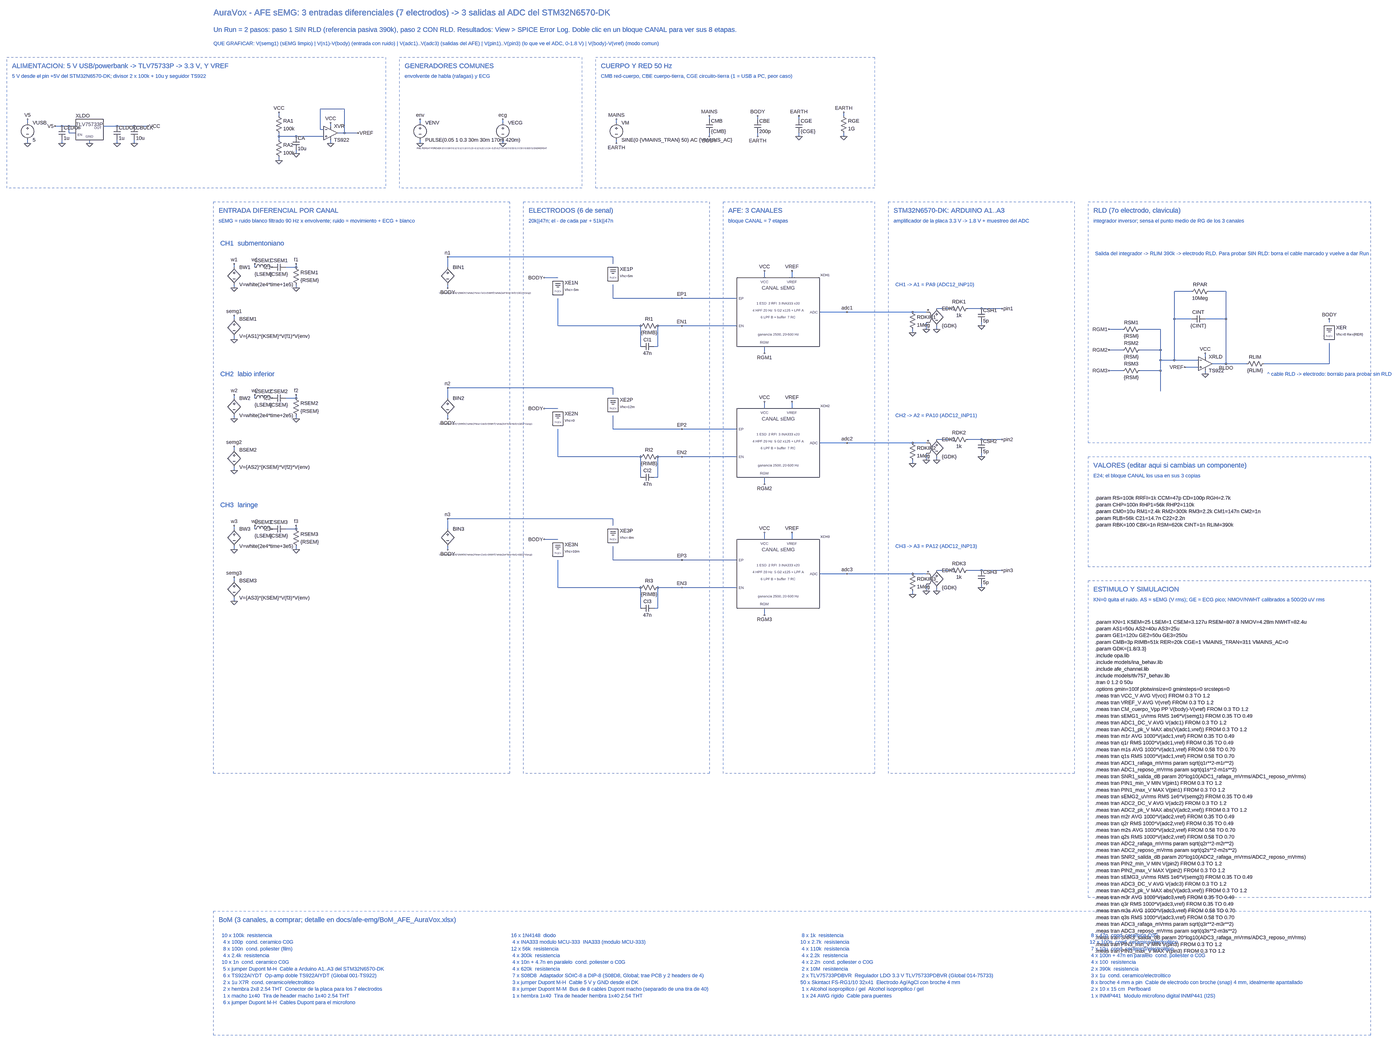
[diagram p0: schematic AuraVox_AFE.asc, whole sheet]
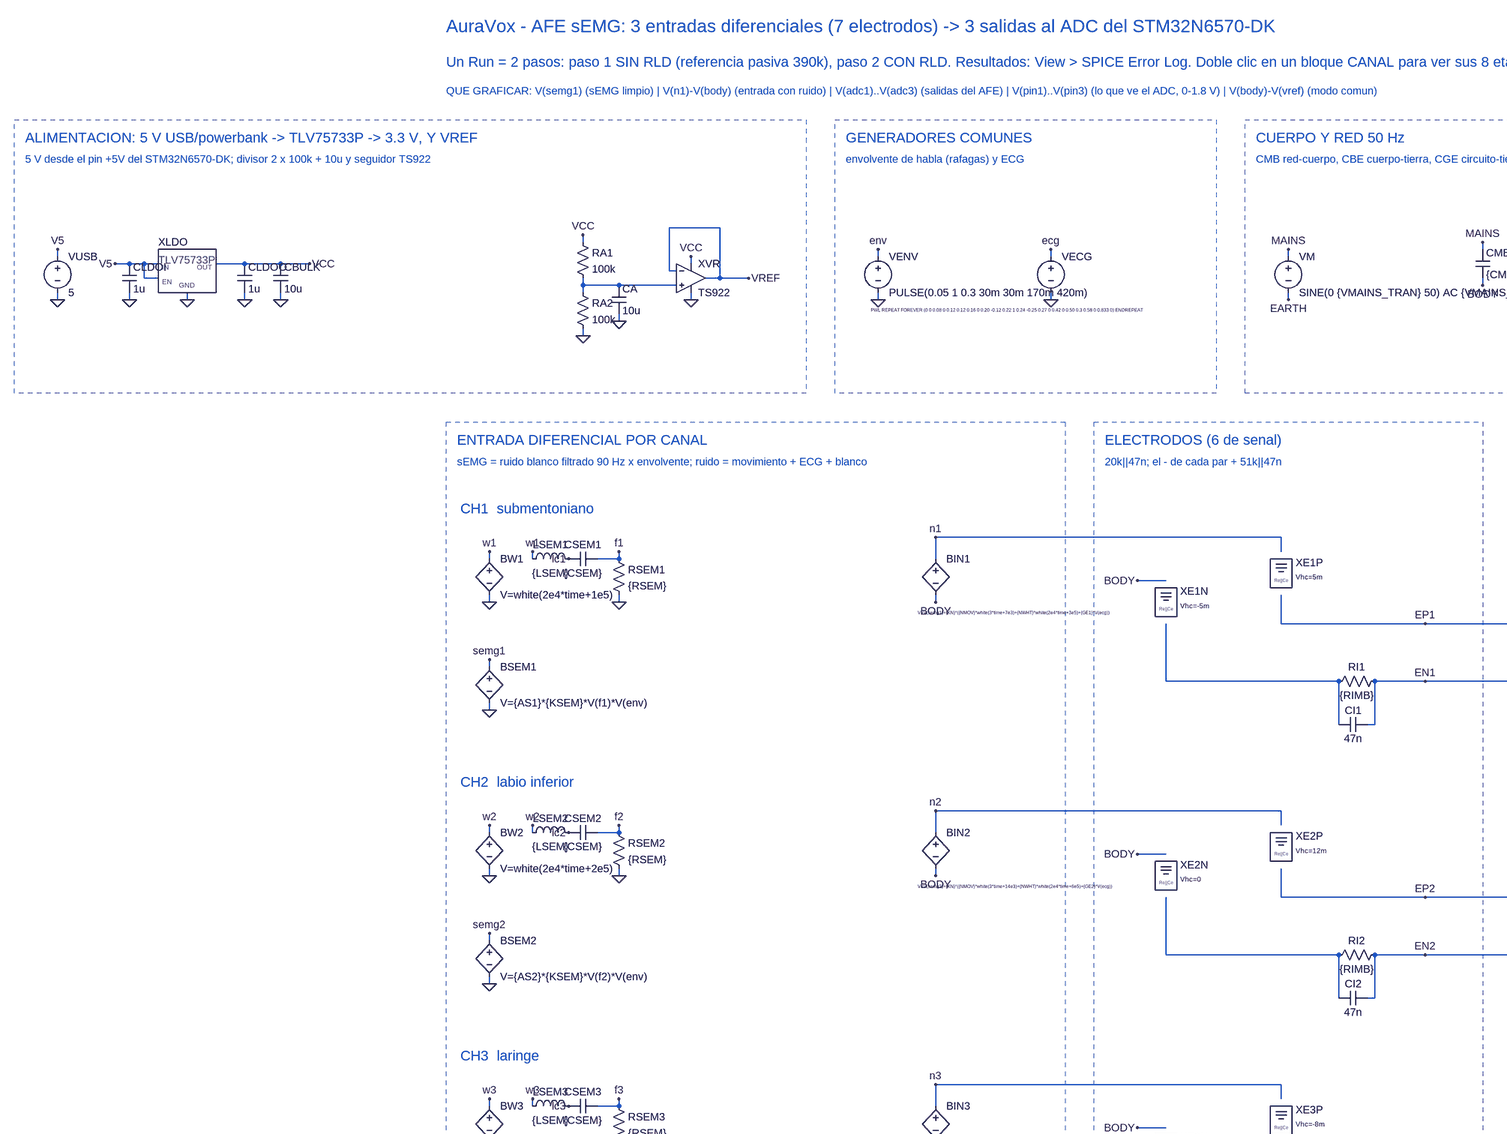
[diagram p1: schematic AuraVox_AFE.asc, part, row 1 of 2, column 1 of 2]
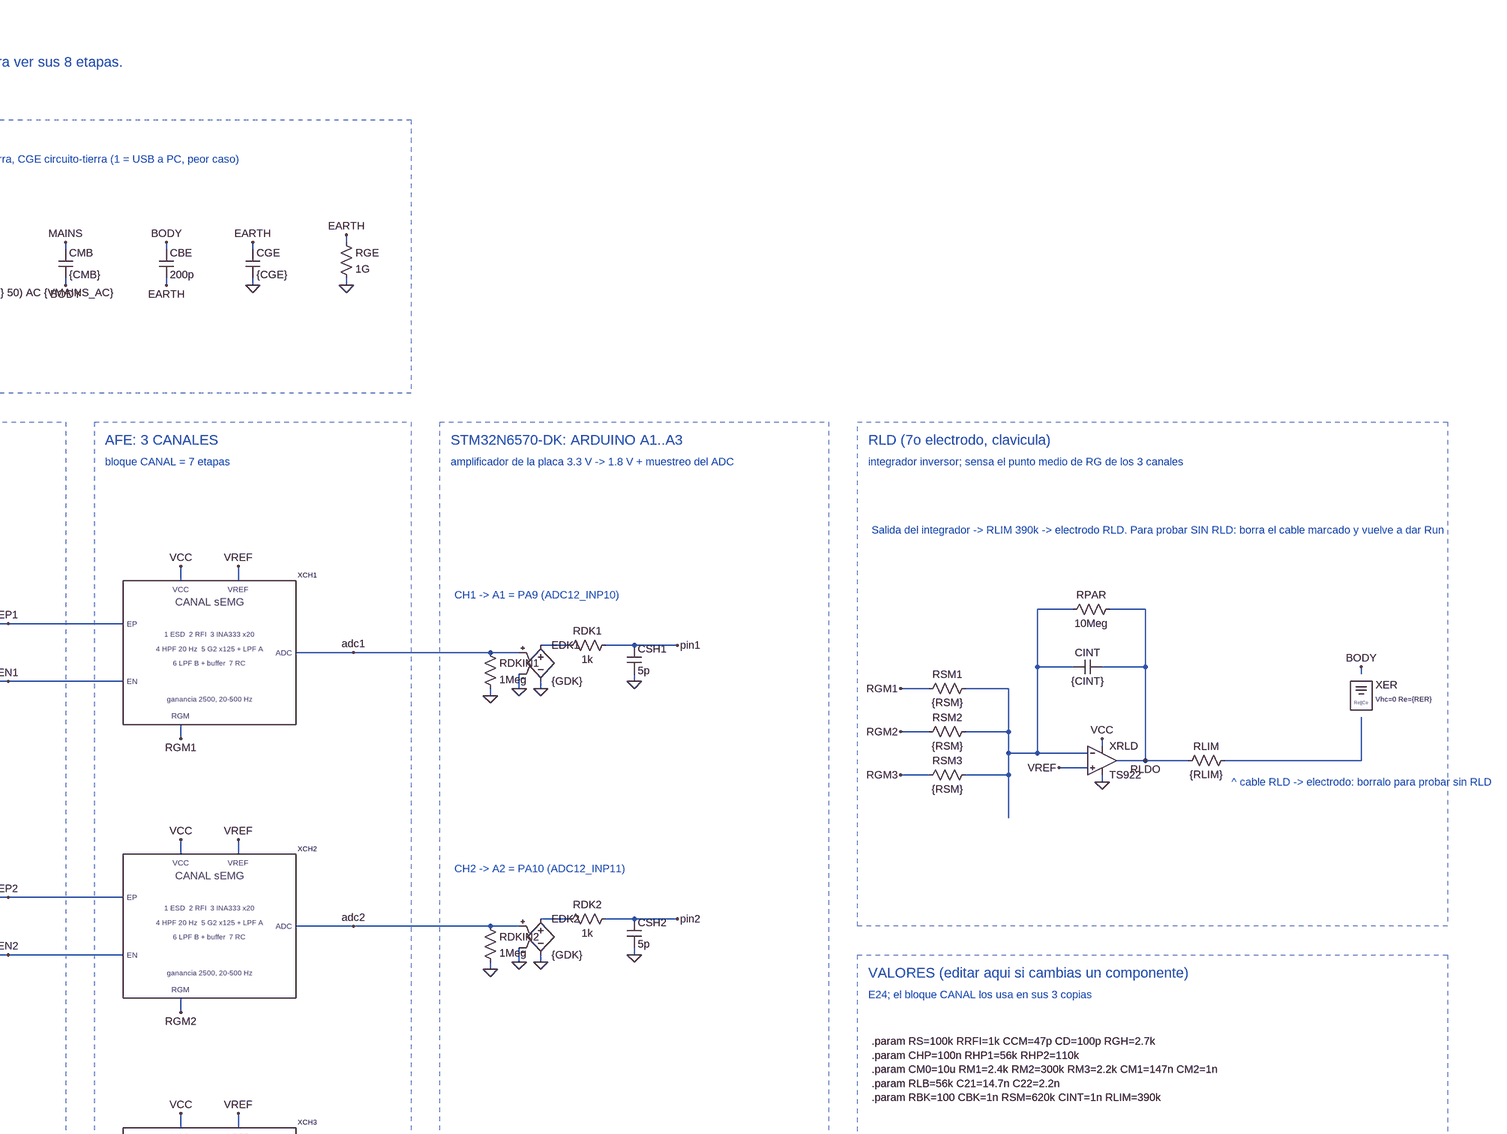
[diagram p2: schematic AuraVox_AFE.asc, part, row 1 of 2, column 2 of 2]
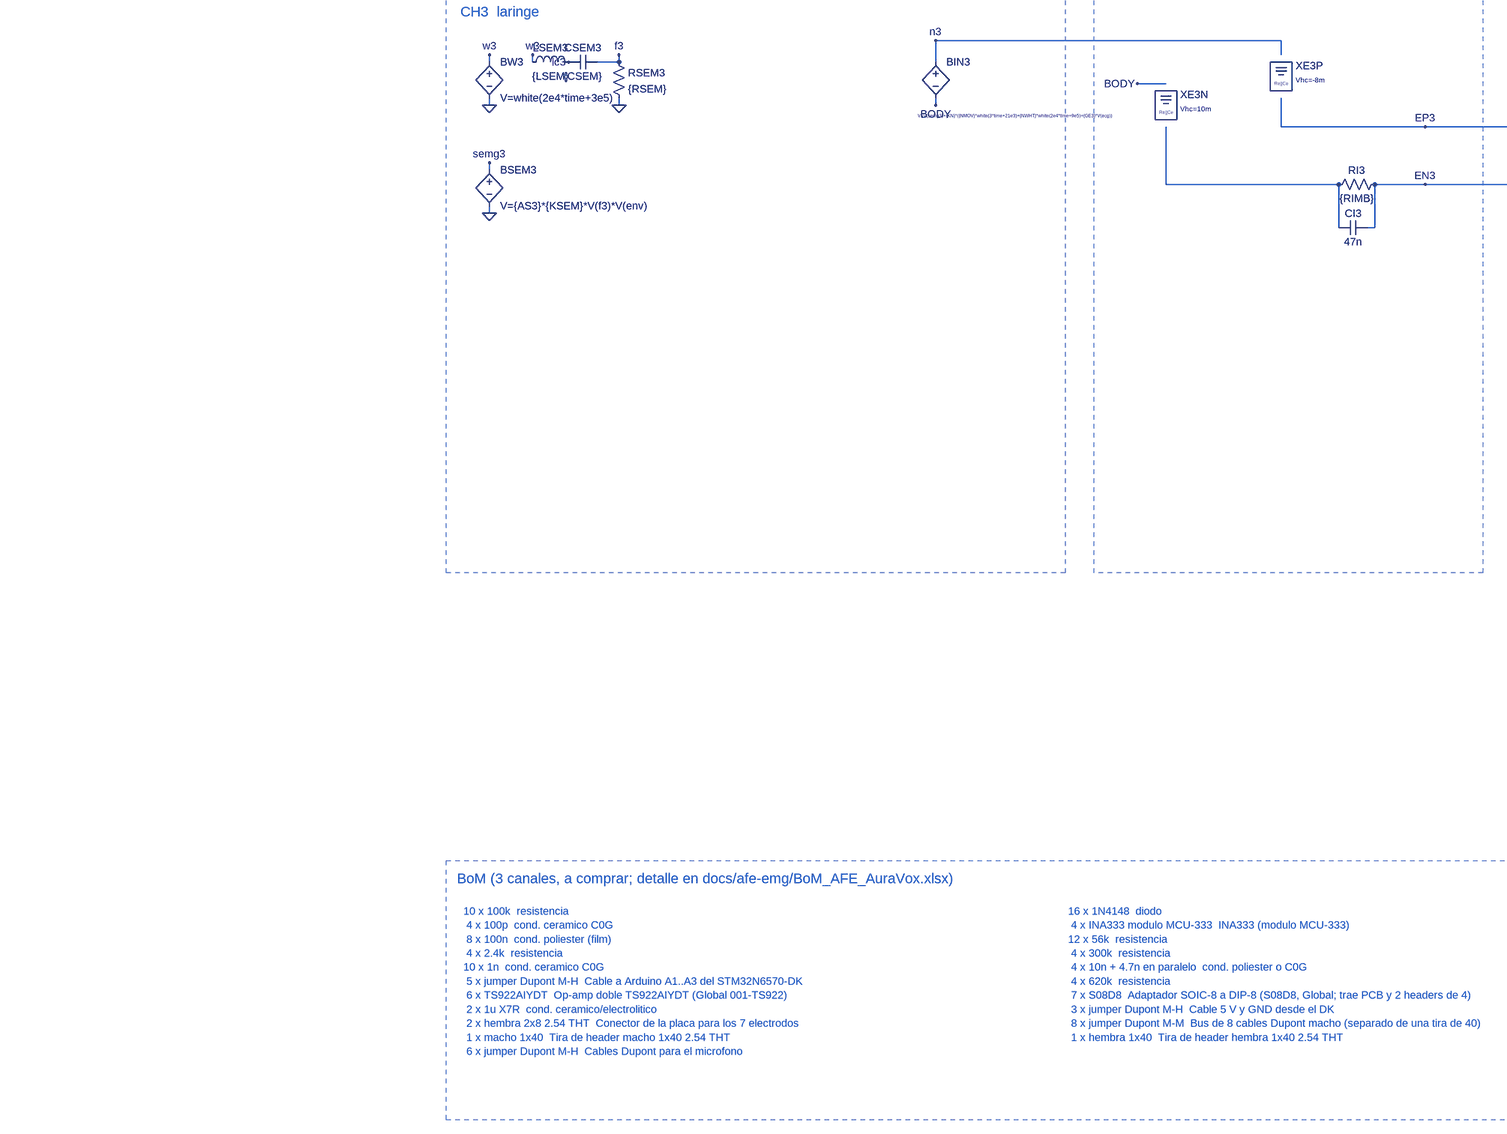
[diagram p3: schematic AuraVox_AFE.asc, part, row 2 of 2, column 1 of 2]
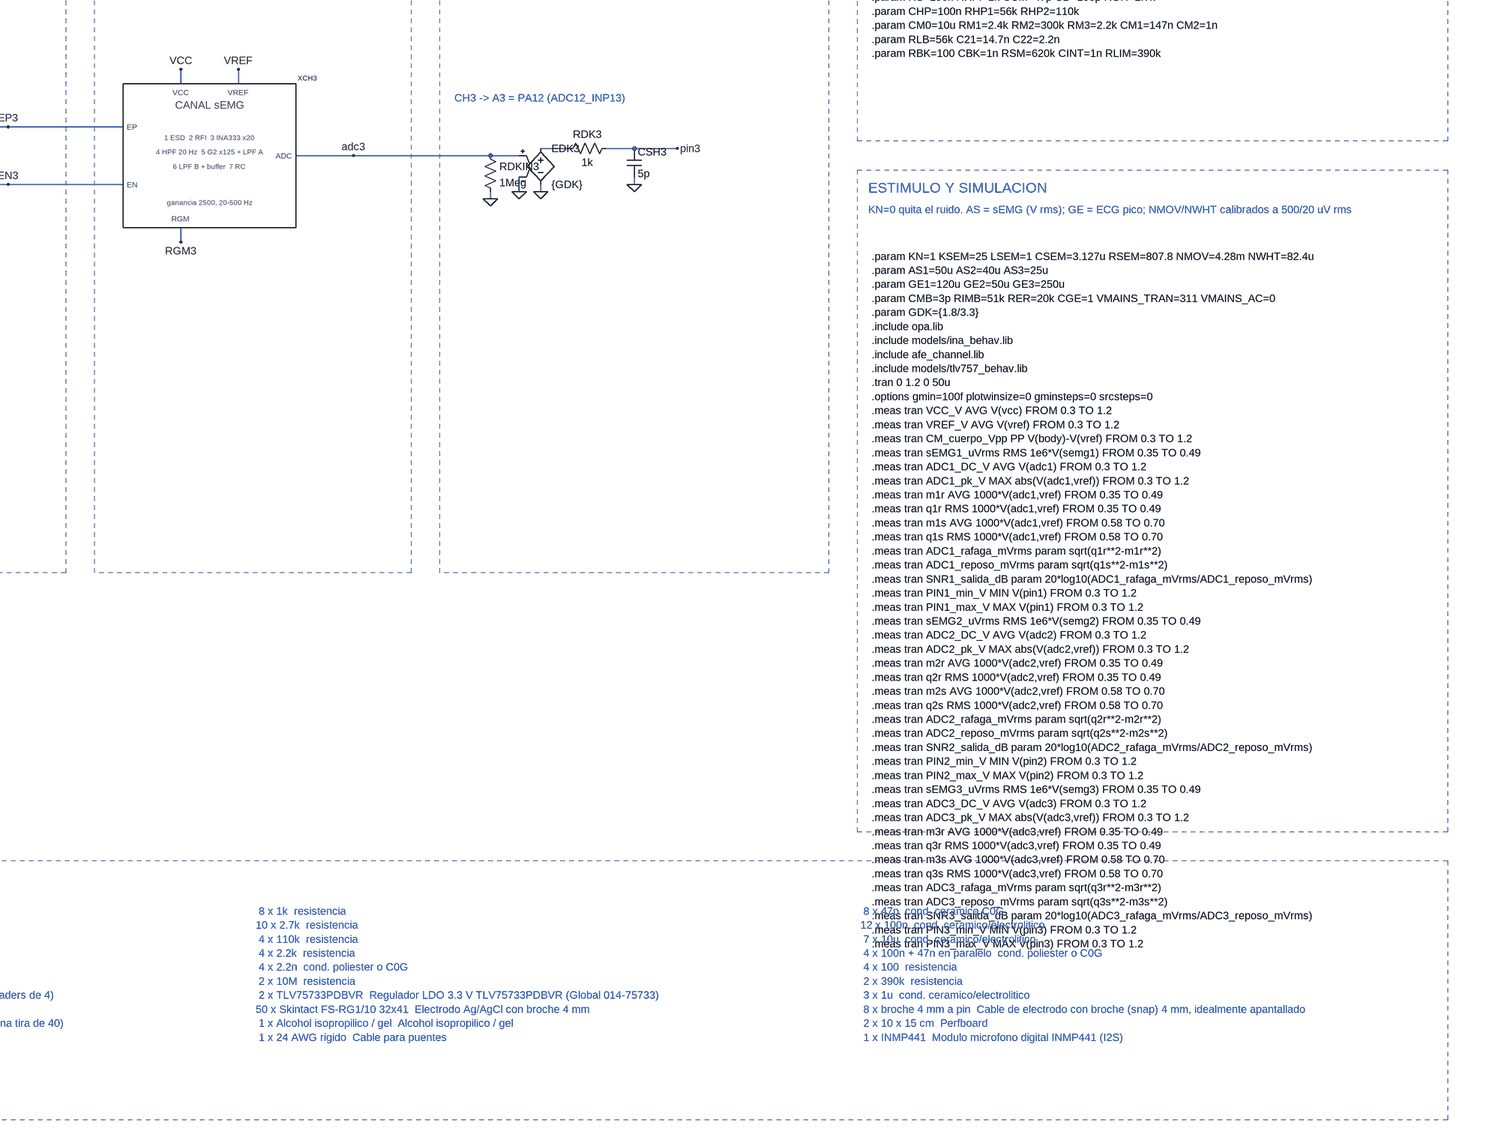
[diagram p4: schematic AuraVox_AFE.asc, part, row 2 of 2, column 2 of 2]
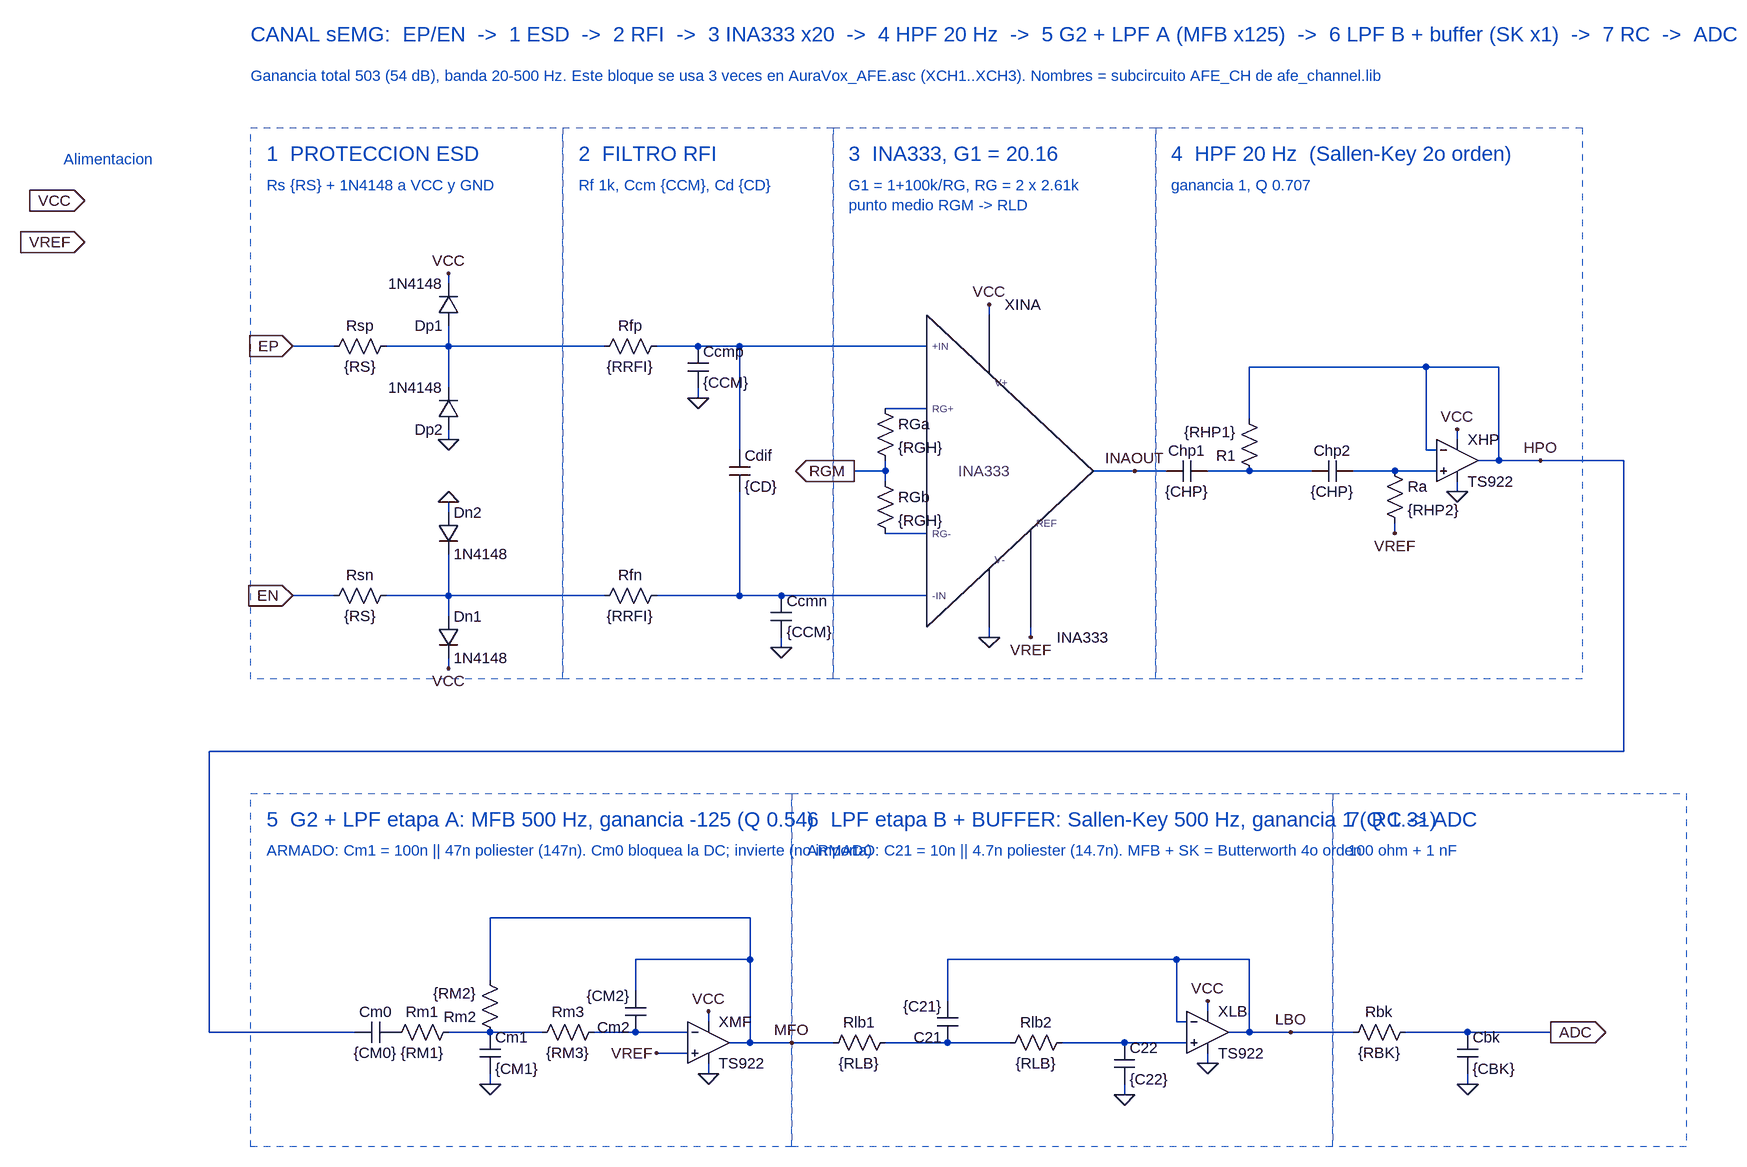
[diagram p5: sub-circuit canal.asc]
AuraVox_AFE.asc, the LTspice schematic file:
Version 4
SHEET 1 4400 3800
WIRE -2464 -560 -2464 -576
WIRE -2464 -480 -2464 -464
WIRE -2240 -544 -2304 -544
WIRE -2304 -544 -2336 -544
WIRE -2240 -512 -2272 -512
WIRE -2272 -512 -2272 -544
WIRE -2304 -480 -2304 -464
WIRE -2176 -480 -2176 -464
WIRE -2112 -544 -2048 -544
WIRE -2048 -544 -1968 -544
WIRE -1968 -544 -1904 -544
WIRE -2048 -480 -2048 -464
WIRE -1968 -480 -1968 -464
WIRE -1296 -592 -1296 -608
WIRE -1296 -512 -1296 -496
WIRE -1296 -496 -1296 -480
WIRE -1296 -400 -1296 -384
WIRE -1296 -496 -1216 -496
WIRE -1216 -496 -1088 -496
WIRE -1216 -432 -1216 -416
WIRE -1056 -544 -1056 -560
WIRE -1056 -480 -1056 -464
WIRE -1024 -512 -992 -512
WIRE -1104 -624 -992 -624
WIRE -992 -624 -992 -512
WIRE -1088 -528 -1104 -528
WIRE -1104 -528 -1104 -624
WIRE -992 -512 -928 -512
WIRE -640 -560 -640 -576
WIRE -640 -480 -640 -464
WIRE -256 -560 -256 -576
WIRE -256 -480 -256 -464
WIRE 272 -560 272 -576
WIRE 272 -480 272 -464
WIRE 704 -576 704 -592
WIRE 704 -512 704 -496
WIRE 928 -576 928 -592
WIRE 928 -512 928 -496
WIRE 1120 -576 1120 -592
WIRE 1120 -512 1120 -496
WIRE 1328 -592 1328 -608
WIRE 1328 -512 1328 -496
WIRE -1504 112 -1504 96
WIRE -1504 192 -1504 208
WIRE -1408 112 -1408 96
WIRE -1264 112 -1216 112
WIRE -1216 112 -1216 96
WIRE -1216 192 -1216 208
WIRE -1504 352 -1504 336
WIRE -1504 432 -1504 448
WIRE -512 192 -512 208
WIRE -512 112 -512 64
WIRE -512 64 256 64
WIRE 256 64 256 96
WIRE 256 192 256 256
WIRE 256 256 576 256
WIRE 576 256 832 256
WIRE 0 160 -64 160
WIRE 0 256 0 384
WIRE 0 384 384 384
WIRE 384 384 384 480
WIRE 448 480 464 480
WIRE 464 480 464 384
WIRE 464 384 576 384
WIRE 576 384 832 384
WIRE 960 160 960 128
WIRE 1088 160 1088 128
WIRE 960 480 960 512
WIRE 1216 320 1344 320
WIRE 1344 320 1600 320
WIRE 1600 320 1648 320
WIRE 1648 320 1712 320
WIRE 1648 400 1648 416
WIRE 1712 368 1712 400
WIRE 1760 384 1760 400
WIRE 1760 304 1824 304
WIRE 1904 304 1968 304
WIRE 1968 304 2064 304
WIRE 1968 368 1968 384
WIRE -1504 720 -1504 704
WIRE -1504 800 -1504 816
WIRE -1408 720 -1408 704
WIRE -1264 720 -1216 720
WIRE -1216 720 -1216 704
WIRE -1216 800 -1216 816
WIRE -1504 960 -1504 944
WIRE -1504 1040 -1504 1056
WIRE -512 800 -512 816
WIRE -512 720 -512 672
WIRE -512 672 256 672
WIRE 256 672 256 704
WIRE 256 800 256 864
WIRE 256 864 576 864
WIRE 576 864 832 864
WIRE 0 768 -64 768
WIRE 0 864 0 992
WIRE 0 992 384 992
WIRE 384 992 384 1088
WIRE 448 1088 464 1088
WIRE 464 1088 464 992
WIRE 464 992 576 992
WIRE 576 992 832 992
WIRE 960 768 960 736
WIRE 1088 768 1088 736
WIRE 960 1088 960 1120
WIRE 1216 928 1344 928
WIRE 1344 928 1600 928
WIRE 1600 928 1648 928
WIRE 1648 928 1712 928
WIRE 1648 1008 1648 1024
WIRE 1712 976 1712 1008
WIRE 1760 992 1760 1008
WIRE 1760 912 1824 912
WIRE 1904 912 1968 912
WIRE 1968 912 2064 912
WIRE 1968 976 1968 992
WIRE -1504 1328 -1504 1312
WIRE -1504 1408 -1504 1424
WIRE -1408 1328 -1408 1312
WIRE -1264 1328 -1216 1328
WIRE -1216 1328 -1216 1312
WIRE -1216 1408 -1216 1424
WIRE -1504 1568 -1504 1552
WIRE -1504 1648 -1504 1664
WIRE -512 1408 -512 1424
WIRE -512 1328 -512 1280
WIRE -512 1280 256 1280
WIRE 256 1280 256 1312
WIRE 256 1408 256 1472
WIRE 256 1472 576 1472
WIRE 576 1472 832 1472
WIRE 0 1376 -64 1376
WIRE 0 1472 0 1600
WIRE 0 1600 384 1600
WIRE 384 1600 384 1696
WIRE 448 1696 464 1696
WIRE 464 1696 464 1600
WIRE 464 1600 576 1600
WIRE 576 1600 832 1600
WIRE 960 1376 960 1344
WIRE 1088 1376 1088 1344
WIRE 960 1696 960 1728
WIRE 1216 1536 1344 1536
WIRE 1344 1536 1600 1536
WIRE 1600 1536 1648 1536
WIRE 1648 1536 1712 1536
WIRE 1648 1616 1648 1632
WIRE 1712 1584 1712 1616
WIRE 1760 1600 1760 1616
WIRE 1760 1520 1824 1520
WIRE 1904 1520 1968 1520
WIRE 1968 1520 2064 1520
WIRE 1968 1584 1968 1600
WIRE 2624 400 2560 400
WIRE 2704 400 2800 400
WIRE 2624 496 2560 496
WIRE 2704 496 2800 496
WIRE 2624 592 2560 592
WIRE 2704 592 2800 592
WIRE 2800 400 2800 688
WIRE 3008 528 3008 512
WIRE 3008 592 3008 608
WIRE 2800 544 2864 544
WIRE 2864 544 2944 544
WIRE 2944 544 2976 544
WIRE 2976 576 2912 576
WIRE 2864 544 2864 352
WIRE 2864 352 2944 352
WIRE 2864 352 2864 224
WIRE 2864 224 2944 224
WIRE 3008 352 3104 352
WIRE 3024 224 3104 224
WIRE 3104 224 3104 352
WIRE 3104 352 3104 560
WIRE 3040 560 3104 560
WIRE 3104 560 3200 560
WIRE 3280 560 3584 560
WIRE 3584 560 3584 464
WIRE 3584 368 3584 352
FLAG -2464 -576 V5
FLAG -2464 -464 0
FLAG -2336 -544 V5
FLAG -2304 -464 0
FLAG -2176 -464 0
FLAG -1904 -544 VCC
FLAG -2048 -464 0
FLAG -1968 -464 0
FLAG -1296 -608 VCC
FLAG -1296 -384 0
FLAG -1216 -416 0
FLAG -1056 -560 VCC
FLAG -1056 -464 0
FLAG -928 -512 VREF
FLAG -640 -576 env
FLAG -640 -464 0
FLAG -256 -576 ecg
FLAG -256 -464 0
FLAG 272 -576 MAINS
FLAG 272 -464 EARTH
FLAG 704 -592 MAINS
FLAG 704 -496 BODY
FLAG 928 -592 BODY
FLAG 928 -496 EARTH
FLAG 1120 -592 EARTH
FLAG 1120 -496 0
FLAG 1328 -608 EARTH
FLAG 1328 -496 0
FLAG -1504 96 w1
FLAG -1504 208 0
FLAG -1408 96 w1
FLAG -1328 112 lc1
FLAG -1216 96 f1
FLAG -1216 208 0
FLAG -1504 336 semg1
FLAG -1504 448 0
FLAG -512 208 BODY
FLAG -512 64 n1
FLAG -64 160 BODY
FLAG 576 256 EP1
FLAG 576 384 EN1
FLAG 960 128 VCC
FLAG 1088 128 VREF
FLAG 960 512 RGM1
FLAG 1344 320 adc1
FLAG 1648 416 0
FLAG 1712 400 0
FLAG 1760 400 0
FLAG 1968 384 0
FLAG 2064 304 pin1
FLAG -1504 704 w2
FLAG -1504 816 0
FLAG -1408 704 w2
FLAG -1328 720 lc2
FLAG -1216 704 f2
FLAG -1216 816 0
FLAG -1504 944 semg2
FLAG -1504 1056 0
FLAG -512 816 BODY
FLAG -512 672 n2
FLAG -64 768 BODY
FLAG 576 864 EP2
FLAG 576 992 EN2
FLAG 960 736 VCC
FLAG 1088 736 VREF
FLAG 960 1120 RGM2
FLAG 1344 928 adc2
FLAG 1648 1024 0
FLAG 1712 1008 0
FLAG 1760 1008 0
FLAG 1968 992 0
FLAG 2064 912 pin2
FLAG -1504 1312 w3
FLAG -1504 1424 0
FLAG -1408 1312 w3
FLAG -1328 1328 lc3
FLAG -1216 1312 f3
FLAG -1216 1424 0
FLAG -1504 1552 semg3
FLAG -1504 1664 0
FLAG -512 1424 BODY
FLAG -512 1280 n3
FLAG -64 1376 BODY
FLAG 576 1472 EP3
FLAG 576 1600 EN3
FLAG 960 1344 VCC
FLAG 1088 1344 VREF
FLAG 960 1728 RGM3
FLAG 1344 1536 adc3
FLAG 1648 1632 0
FLAG 1712 1616 0
FLAG 1760 1616 0
FLAG 1968 1600 0
FLAG 2064 1520 pin3
FLAG 2560 400 RGM1
FLAG 2560 496 RGM2
FLAG 2560 592 RGM3
FLAG 3008 512 VCC
FLAG 3008 608 0
FLAG 2912 576 VREF
FLAG 3584 352 BODY
FLAG 3104 560 RLDO
SYMBOL voltage -2464 -576 R0
SYMATTR InstName VUSB
SYMATTR Value 5
SYMBOL TLV75733P -2176 -528 R0
SYMATTR InstName XLDO
SYMATTR Value TLV75733P
SYMBOL cap -2320 -544 R0
SYMATTR InstName CLDOI
SYMATTR Value 1u
SYMBOL cap -2064 -544 R0
SYMATTR InstName CLDOO
SYMATTR Value 1u
SYMBOL cap -1984 -544 R0
SYMATTR InstName CBULK
SYMATTR Value 10u
SYMBOL res -1312 -608 R0
SYMATTR InstName RA1
SYMATTR Value 100k
SYMBOL res -1312 -496 R0
SYMATTR InstName RA2
SYMATTR Value 100k
SYMBOL cap -1232 -496 R0
SYMATTR InstName CA
SYMATTR Value 10u
SYMBOL OpAmps\\opamp2 -1056 -576 R0
SYMATTR InstName XVR
SYMATTR Value TS922
SYMBOL voltage -640 -576 R0
SYMATTR InstName VENV
SYMATTR Value PULSE(0.05 1 0.3 30m 30m 170m 420m)
SYMBOL voltage -256 -576 R0
WINDOW 0 24 16 Left 2
WINDOW 3 -400 136 Left 0
SYMATTR InstName VECG
SYMATTR Value PWL REPEAT FOREVER (0 0 0.08 0 0.12 0.12 0.16 0 0.20 -0.12 0.22 1 0.24 -0.25 0.27 0 0.42 0 0.50 0.3 0.58 0 0.833 0) ENDREPEAT
SYMBOL voltage 272 -576 R0
SYMATTR InstName VM
SYMATTR Value SINE(0 {VMAINS_TRAN} 50) AC {VMAINS_AC}
SYMBOL cap 688 -576 R0
SYMATTR InstName CMB
SYMATTR Value {CMB}
SYMBOL cap 912 -576 R0
SYMATTR InstName CBE
SYMATTR Value 200p
SYMBOL cap 1104 -576 R0
SYMATTR InstName CGE
SYMATTR Value {CGE}
SYMBOL res 1312 -608 R0
SYMATTR InstName RGE
SYMATTR Value 1G
SYMBOL bv -1504 96 R0
SYMATTR InstName BW1
SYMATTR Value V=white(2e4*time+1e5)
SYMBOL ind -1424 128 R270
WINDOW 0 32 56 VTop 2
WINDOW 3 0 56 VBottom 2
SYMATTR InstName LSEM1
SYMATTR Value {LSEM}
SYMBOL cap -1328 128 R270
WINDOW 0 32 32 VTop 2
WINDOW 3 0 32 VBottom 2
SYMATTR InstName CSEM1
SYMATTR Value {CSEM}
SYMBOL res -1232 96 R0
SYMATTR InstName RSEM1
SYMATTR Value {RSEM}
SYMBOL bv -1504 336 R0
SYMATTR InstName BSEM1
SYMATTR Value V={AS1}*{KSEM}*V(f1)*V(env)
SYMBOL bv -512 96 R0
WINDOW 0 24 16 Left 2
WINDOW 3 -40 136 Left 0
SYMATTR InstName BIN1
SYMATTR Value V=V(semg1)+{KN}*({NMOV}*white(3*time+7e3)+{NWHT}*white(2e4*time+3e5)+{GE1}*V(ecg))
SYMBOL ELECTRODO 256 96 R0
SYMATTR InstName XE1P
SYMATTR Value ELECTRODE
SYMATTR SpiceLine Vhc=5m
SYMBOL ELECTRODO 0 160 R0
SYMATTR InstName XE1N
SYMATTR Value ELECTRODE
SYMATTR SpiceLine Vhc=-5m
SYMBOL res 368 400 R270
WINDOW 0 32 56 VTop 2
WINDOW 3 0 56 VBottom 2
SYMATTR InstName RI1
SYMATTR Value {RIMB}
SYMBOL cap 384 496 R270
WINDOW 0 32 32 VTop 2
WINDOW 3 0 32 VBottom 2
SYMATTR InstName CI1
SYMATTR Value 47n
SYMBOL CANAL 1024 320 R0
SYMATTR InstName XCH1
SYMBOL res 1632 304 R0
SYMATTR InstName RDKIN1
SYMATTR Value 1Meg
SYMBOL e 1760 288 R0
SYMATTR InstName EDK1
SYMATTR Value {GDK}
SYMBOL res 1808 320 R270
WINDOW 0 32 56 VTop 2
WINDOW 3 0 56 VBottom 2
SYMATTR InstName RDK1
SYMATTR Value 1k
SYMBOL cap 1952 304 R0
SYMATTR InstName CSH1
SYMATTR Value 5p
SYMBOL bv -1504 704 R0
SYMATTR InstName BW2
SYMATTR Value V=white(2e4*time+2e5)
SYMBOL ind -1424 736 R270
WINDOW 0 32 56 VTop 2
WINDOW 3 0 56 VBottom 2
SYMATTR InstName LSEM2
SYMATTR Value {LSEM}
SYMBOL cap -1328 736 R270
WINDOW 0 32 32 VTop 2
WINDOW 3 0 32 VBottom 2
SYMATTR InstName CSEM2
SYMATTR Value {CSEM}
SYMBOL res -1232 704 R0
SYMATTR InstName RSEM2
SYMATTR Value {RSEM}
SYMBOL bv -1504 944 R0
SYMATTR InstName BSEM2
SYMATTR Value V={AS2}*{KSEM}*V(f2)*V(env)
SYMBOL bv -512 704 R0
WINDOW 0 24 16 Left 2
WINDOW 3 -40 136 Left 0
SYMATTR InstName BIN2
SYMATTR Value V=V(semg2)+{KN}*({NMOV}*white(3*time+14e3)+{NWHT}*white(2e4*time+6e5)+{GE2}*V(ecg))
SYMBOL ELECTRODO 256 704 R0
SYMATTR InstName XE2P
SYMATTR Value ELECTRODE
SYMATTR SpiceLine Vhc=12m
SYMBOL ELECTRODO 0 768 R0
SYMATTR InstName XE2N
SYMATTR Value ELECTRODE
SYMATTR SpiceLine Vhc=0
SYMBOL res 368 1008 R270
WINDOW 0 32 56 VTop 2
WINDOW 3 0 56 VBottom 2
SYMATTR InstName RI2
SYMATTR Value {RIMB}
SYMBOL cap 384 1104 R270
WINDOW 0 32 32 VTop 2
WINDOW 3 0 32 VBottom 2
SYMATTR InstName CI2
SYMATTR Value 47n
SYMBOL CANAL 1024 928 R0
SYMATTR InstName XCH2
SYMBOL res 1632 912 R0
SYMATTR InstName RDKIN2
SYMATTR Value 1Meg
SYMBOL e 1760 896 R0
SYMATTR InstName EDK2
SYMATTR Value {GDK}
SYMBOL res 1808 928 R270
WINDOW 0 32 56 VTop 2
WINDOW 3 0 56 VBottom 2
SYMATTR InstName RDK2
SYMATTR Value 1k
SYMBOL cap 1952 912 R0
SYMATTR InstName CSH2
SYMATTR Value 5p
SYMBOL bv -1504 1312 R0
SYMATTR InstName BW3
SYMATTR Value V=white(2e4*time+3e5)
SYMBOL ind -1424 1344 R270
WINDOW 0 32 56 VTop 2
WINDOW 3 0 56 VBottom 2
SYMATTR InstName LSEM3
SYMATTR Value {LSEM}
SYMBOL cap -1328 1344 R270
WINDOW 0 32 32 VTop 2
WINDOW 3 0 32 VBottom 2
SYMATTR InstName CSEM3
SYMATTR Value {CSEM}
SYMBOL res -1232 1312 R0
SYMATTR InstName RSEM3
SYMATTR Value {RSEM}
SYMBOL bv -1504 1552 R0
SYMATTR InstName BSEM3
SYMATTR Value V={AS3}*{KSEM}*V(f3)*V(env)
SYMBOL bv -512 1312 R0
WINDOW 0 24 16 Left 2
WINDOW 3 -40 136 Left 0
SYMATTR InstName BIN3
SYMATTR Value V=V(semg3)+{KN}*({NMOV}*white(3*time+21e3)+{NWHT}*white(2e4*time+9e5)+{GE3}*V(ecg))
SYMBOL ELECTRODO 256 1312 R0
SYMATTR InstName XE3P
SYMATTR Value ELECTRODE
SYMATTR SpiceLine Vhc=-8m
SYMBOL ELECTRODO 0 1376 R0
SYMATTR InstName XE3N
SYMATTR Value ELECTRODE
SYMATTR SpiceLine Vhc=10m
SYMBOL res 368 1616 R270
WINDOW 0 32 56 VTop 2
WINDOW 3 0 56 VBottom 2
SYMATTR InstName RI3
SYMATTR Value {RIMB}
SYMBOL cap 384 1712 R270
WINDOW 0 32 32 VTop 2
WINDOW 3 0 32 VBottom 2
SYMATTR InstName CI3
SYMATTR Value 47n
SYMBOL CANAL 1024 1536 R0
SYMATTR InstName XCH3
SYMBOL res 1632 1520 R0
SYMATTR InstName RDKIN3
SYMATTR Value 1Meg
SYMBOL e 1760 1504 R0
SYMATTR InstName EDK3
SYMATTR Value {GDK}
SYMBOL res 1808 1536 R270
WINDOW 0 32 56 VTop 2
WINDOW 3 0 56 VBottom 2
SYMATTR InstName RDK3
SYMATTR Value 1k
SYMBOL cap 1952 1520 R0
SYMATTR InstName CSH3
SYMATTR Value 5p
SYMBOL res 2608 416 R270
WINDOW 0 32 56 VTop 2
WINDOW 3 0 56 VBottom 2
SYMATTR InstName RSM1
SYMATTR Value {RSM}
SYMBOL res 2608 512 R270
WINDOW 0 32 56 VTop 2
WINDOW 3 0 56 VBottom 2
SYMATTR InstName RSM2
SYMATTR Value {RSM}
SYMBOL res 2608 608 R270
WINDOW 0 32 56 VTop 2
WINDOW 3 0 56 VBottom 2
SYMATTR InstName RSM3
SYMATTR Value {RSM}
SYMBOL OpAmps\\opamp2 3008 496 R0
SYMATTR InstName XRLD
SYMATTR Value TS922
SYMBOL cap 2944 368 R270
WINDOW 0 32 32 VTop 2
WINDOW 3 0 32 VBottom 2
SYMATTR InstName CINT
SYMATTR Value {CINT}
SYMBOL res 2928 240 R270
WINDOW 0 32 56 VTop 2
WINDOW 3 0 56 VBottom 2
SYMATTR InstName RPAR
SYMATTR Value 10Meg
SYMBOL res 3184 576 R270
WINDOW 0 32 56 VTop 2
WINDOW 3 0 56 VBottom 2
SYMATTR InstName RLIM
SYMATTR Value {RLIM}
SYMBOL ELECTRODO 3584 368 R0
SYMATTR InstName XER
SYMATTR Value ELECTRODE
SYMATTR SpiceLine Vhc=0 Re={RER}
TEXT -1600 -1072 Left 4 ;AuraVox - AFE sEMG: 3 entradas diferenciales (7 electrodos) -> 3 salidas al ADC del STM32N6570-DK
TEXT -1600 -992 Left 3 ;Un Run = 2 pasos: paso 1 SIN RLD (referencia pasiva 390k), paso 2 CON RLD. Resultados: View > SPICE Error Log. Doble clic en un bloque CANAL para ver sus 8 etapas.
TEXT -1600 -928 Left 2 ;QUE GRAFICAR: V(semg1) (sEMG limpio) | V(n1)-V(body) (entrada con ruido) | V(adc1)..V(adc3) (salidas del AFE) | V(pin1)..V(pin3) (lo que ve el ADC, 0-1.8 V) | V(body)-V(vref) (modo comun)
RECTANGLE Normal -2560 -864 -800 -256 2
TEXT -2536 -824 Left 3 ;ALIMENTACION: 5 V USB/powerbank -> TLV75733P -> 3.3 V, Y VREF
TEXT -2536 -776 Left 2 ;5 V desde el pin +5V del STM32N6570-DK; divisor 2 x 100k + 10u y seguidor TS922
RECTANGLE Normal -736 -864 112 -256 2
TEXT -712 -824 Left 3 ;GENERADORES COMUNES
TEXT -712 -776 Left 2 ;envolvente de habla (rafagas) y ECG
RECTANGLE Normal 176 -864 1472 -256 2
TEXT 200 -824 Left 3 ;CUERPO Y RED 50 Hz
TEXT 200 -776 Left 2 ;CMB red-cuerpo, CBE cuerpo-tierra, CGE circuito-tierra (1 = USB a PC, peor caso)
RECTANGLE Normal -1600 -192 -224 2464 2
TEXT -1576 -152 Left 3 ;ENTRADA DIFERENCIAL POR CANAL
TEXT -1576 -104 Left 2 ;sEMG = ruido blanco filtrado 90 Hz x envolvente; ruido = movimiento + ECG + blanco
RECTANGLE Normal -160 -192 704 2464 2
TEXT -136 -152 Left 3 ;ELECTRODOS (6 de senal)
TEXT -136 -104 Left 2 ;20k||47n; el - de cada par + 51k||47n
RECTANGLE Normal 768 -192 1472 2464 2
TEXT 792 -152 Left 3 ;AFE: 3 CANALES
TEXT 792 -104 Left 2 ;bloque CANAL = 7 etapas
RECTANGLE Normal 1536 -192 2400 2464 2
TEXT 1560 -152 Left 3 ;STM32N6570-DK: ARDUINO A1..A3
TEXT 1560 -104 Left 2 ;amplificador de la placa 3.3 V -> 1.8 V + muestreo del ADC
TEXT -1568 0 Left 3 ;CH1  submentoniano
TEXT 1568 192 Left 2 ;CH1 -> A1 = PA9 (ADC12_INP10)
TEXT -1568 608 Left 3 ;CH2  labio inferior
TEXT 1568 800 Left 2 ;CH2 -> A2 = PA10 (ADC12_INP11)
TEXT -1568 1216 Left 3 ;CH3  laringe
TEXT 1568 1408 Left 2 ;CH3 -> A3 = PA12 (ADC12_INP13)
RECTANGLE Normal 2464 -192 3776 928 2
TEXT 2488 -152 Left 3 ;RLD (7o electrodo, clavicula)
TEXT 2488 -104 Left 2 ;integrador inversor; sensa el punto medio de RG de los 3 canales
TEXT 2496 48 Left 2 ;Salida del integrador -> RLIM 390k -> electrodo RLD. Para probar SIN RLD: borra el cable marcado y vuelve a dar Run
TEXT 3296 608 Left 2 ;^ cable RLD -> electrodo: borralo para probar sin RLD
RECTANGLE Normal 2464 992 3776 1504 2
TEXT 2488 1032 Left 3 ;VALORES (editar aqui si cambias un componente)
TEXT 2488 1080 Left 2 ;E24; el bloque CANAL los usa en sus 3 copias
TEXT 2496 1184 Left 2 !.param RS=100k RRFI=1k CCM=47p CD=100p RGH=2.7k\n.param CHP=100n RHP1=56k RHP2=110k\n.param CM0=10u RM1=2.4k RM2=300k RM3=2.2k CM1=147n CM2=1n\n.param RLB=56k C21=14.7n C22=2.2n\n.param RBK=100 CBK=1n RSM=620k CINT=1n RLIM=390k
RECTANGLE Normal 2464 1568 3776 3040 2
TEXT 2488 1608 Left 3 ;ESTIMULO Y SIMULACION
TEXT 2488 1656 Left 2 ;KN=0 quita el ruido. AS = sEMG (V rms); GE = ECG pico; NMOV/NWHT calibrados a 500/20 uV rms
TEXT 2496 1760 Left 2 !.param KN=1 KSEM=25 LSEM=1 CSEM=3.127u RSEM=807.8 NMOV=4.28m NWHT=82.4u\n.param AS1=50u AS2=40u AS3=25u\n.param GE1=120u GE2=50u GE3=250u\n.param CMB=3p RIMB=51k RER=20k CGE=1 VMAINS_TRAN=311 VMAINS_AC=0\n.param GDK={1.8/3.3}\n.include opa.lib\n.include models/ina_behav.lib\n.include afe_channel.lib\n.include models/tlv757_behav.lib\n.tran 0 1.2 0 50u\n.options gmin=100f plotwinsize=0 gminsteps=0 srcsteps=0\n.meas tran VCC_V AVG V(vcc) FROM 0.3 TO 1.2\n.meas tran VREF_V AVG V(vref) FROM 0.3 TO 1.2\n.meas tran CM_cuerpo_Vpp PP V(body)-V(vref) FROM 0.3 TO 1.2\n.meas tran sEMG1_uVrms RMS 1e6*V(semg1) FROM 0.35 TO 0.49\n.meas tran ADC1_DC_V AVG V(adc1) FROM 0.3 TO 1.2\n.meas tran ADC1_pk_V MAX abs(V(adc1,vref)) FROM 0.3 TO 1.2\n.meas tran m1r AVG 1000*V(adc1,vref) FROM 0.35 TO 0.49\n.meas tran q1r RMS 1000*V(adc1,vref) FROM 0.35 TO 0.49\n.meas tran m1s AVG 1000*V(adc1,vref) FROM 0.58 TO 0.70\n.meas tran q1s RMS 1000*V(adc1,vref) FROM 0.58 TO 0.70\n.meas tran ADC1_rafaga_mVrms param sqrt(q1r**2-m1r**2)\n.meas tran ADC1_reposo_mVrms param sqrt(q1s**2-m1s**2)\n.meas tran SNR1_salida_dB param 20*log10(ADC1_rafaga_mVrms/ADC1_reposo_mVrms)\n.meas tran PIN1_min_V MIN V(pin1) FROM 0.3 TO 1.2\n.meas tran PIN1_max_V MAX V(pin1) FROM 0.3 TO 1.2\n.meas tran sEMG2_uVrms RMS 1e6*V(semg2) FROM 0.35 TO 0.49\n.meas tran ADC2_DC_V AVG V(adc2) FROM 0.3 TO 1.2\n.meas tran ADC2_pk_V MAX abs(V(adc2,vref)) FROM 0.3 TO 1.2\n.meas tran m2r AVG 1000*V(adc2,vref) FROM 0.35 TO 0.49\n.meas tran q2r RMS 1000*V(adc2,vref) FROM 0.35 TO 0.49\n.meas tran m2s AVG 1000*V(adc2,vref) FROM 0.58 TO 0.70\n.meas tran q2s RMS 1000*V(adc2,vref) FROM 0.58 TO 0.70\n.meas tran ADC2_rafaga_mVrms param sqrt(q2r**2-m2r**2)\n.meas tran ADC2_reposo_mVrms param sqrt(q2s**2-m2s**2)\n.meas tran SNR2_salida_dB param 20*log10(ADC2_rafaga_mVrms/ADC2_reposo_mVrms)\n.meas tran PIN2_min_V MIN V(pin2) FROM 0.3 TO 1.2\n.meas tran PIN2_max_V MAX V(pin2) FROM 0.3 TO 1.2\n.meas tran sEMG3_uVrms RMS 1e6*V(semg3) FROM 0.35 TO 0.49\n.meas tran ADC3_DC_V AVG V(adc3) FROM 0.3 TO 1.2\n.meas tran ADC3_pk_V MAX abs(V(adc3,vref)) FROM 0.3 TO 1.2\n.meas tran m3r AVG 1000*V(adc3,vref) FROM 0.35 TO 0.49\n.meas tran q3r RMS 1000*V(adc3,vref) FROM 0.35 TO 0.49\n.meas tran m3s AVG 1000*V(adc3,vref) FROM 0.58 TO 0.70\n.meas tran q3s RMS 1000*V(adc3,vref) FROM 0.58 TO 0.70\n.meas tran ADC3_rafaga_mVrms param sqrt(q3r**2-m3r**2)\n.meas tran ADC3_reposo_mVrms param sqrt(q3s**2-m3s**2)\n.meas tran SNR3_salida_dB param 20*log10(ADC3_rafaga_mVrms/ADC3_reposo_mVrms)\n.meas tran PIN3_min_V MIN V(pin3) FROM 0.3 TO 1.2\n.meas tran PIN3_max_V MAX V(pin3) FROM 0.3 TO 1.2
RECTANGLE Normal -1600 3104 3776 3680 2
TEXT -1576 3144 Left 3 ;BoM (3 canales, a comprar; detalle en docs/afe-emg/BoM_AFE_AuraVox.xlsx)
TEXT -1568 3216 Left 2 ; 10 x 100k  resistencia\n  4 x 100p  cond. ceramico C0G\n  8 x 100n  cond. poliester (film)\n  4 x 2.4k  resistencia\n 10 x 1n  cond. ceramico C0G\n  5 x jumper Dupont M-H  Cable a Arduino A1..A3 del STM32N6570-DK\n  6 x TS922AIYDT  Op-amp doble TS922AIYDT (Global 001-TS922)\n  2 x 1u X7R  cond. ceramico/electrolitico\n  2 x hembra 2x8 2.54 THT  Conector de la placa para los 7 electrodos\n  1 x macho 1x40  Tira de header macho 1x40 2.54 THT\n  6 x jumper Dupont M-H  Cables Dupont para el microfono
TEXT -224 3216 Left 2 ; 16 x 1N4148  diodo\n  4 x INA333 modulo MCU-333  INA333 (modulo MCU-333)\n 12 x 56k  resistencia\n  4 x 300k  resistencia\n  4 x 10n + 4.7n en paralelo  cond. poliester o C0G\n  4 x 620k  resistencia\n  7 x S08D8  Adaptador SOIC-8 a DIP-8 (S08D8, Global; trae PCB y 2 headers de 4)\n  3 x jumper Dupont M-H  Cable 5 V y GND desde el DK\n  8 x jumper Dupont M-M  Bus de 8 cables Dupont macho (separado de una tira de 40)\n  1 x hembra 1x40  Tira de header hembra 1x40 2.54 THT
TEXT 1120 3216 Left 2 ;  8 x 1k  resistencia\n 10 x 2.7k  resistencia\n  4 x 110k  resistencia\n  4 x 2.2k  resistencia\n  4 x 2.2n  cond. poliester o C0G\n  2 x 10M  resistencia\n  2 x TLV75733PDBVR  Regulador LDO 3.3 V TLV75733PDBVR (Global 014-75733)\n 50 x Skintact FS-RG1/10 32x41  Electrodo Ag/AgCl con broche 4 mm\n  1 x Alcohol isopropilico / gel  Alcohol isopropilico / gel\n  1 x 24 AWG rigido  Cable para puentes
TEXT 2464 3216 Left 2 ;  8 x 47p  cond. ceramico C0G\n 12 x 100n  cond. ceramico/electrolitico\n  7 x 10u  cond. ceramico/electrolitico\n  4 x 100n + 47n en paralelo  cond. poliester o C0G\n  4 x 100  resistencia\n  2 x 390k  resistencia\n  3 x 1u  cond. ceramico/electrolitico\n  8 x broche 4 mm a pin  Cable de electrodo con broche (snap) 4 mm, idealmente apantallado\n  2 x 10 x 15 cm  Perfboard\n  1 x INMP441  Modulo microfono digital INMP441 (I2S)

canal.asc, the sub-circuit schematic file:
Version 4
SHEET 1 3000 1300
WIRE 32 0 -32 0
WIRE 112 0 208 0
WIRE 208 0 448 0
WIRE 32 384 -32 384
WIRE 112 384 208 384
WIRE 208 384 448 384
WIRE 208 0 208 -32
WIRE 208 -96 208 -112
WIRE 208 0 208 64
WIRE 208 128 208 144
WIRE 208 384 208 416
WIRE 208 480 208 496
WIRE 208 320 208 384
WIRE 208 256 208 240
WIRE 528 0 592 0
WIRE 592 0 656 0
WIRE 656 0 720 0
WIRE 720 0 944 0
WIRE 528 384 592 384
WIRE 592 384 656 384
WIRE 656 384 720 384
WIRE 720 384 944 384
WIRE 592 64 592 80
WIRE 656 0 656 160
WIRE 656 224 656 384
WIRE 720 448 720 464
WIRE 944 96 880 96
WIRE 880 176 880 192
WIRE 880 192 880 208
WIRE 880 288 944 288
WIRE 880 192 832 192
WIRE 1040 -48 1040 -64
WIRE 1040 432 1040 448
WIRE 1104 432 1104 448
WIRE 1200 192 1264 192
WIRE 1264 192 1312 192
WIRE 1376 192 1440 192
WIRE 1440 192 1536 192
WIRE 1600 192 1664 192
WIRE 1664 192 1728 192
WIRE 1664 272 1664 288
WIRE 1760 144 1760 128
WIRE 1760 208 1760 224
WIRE 1440 112 1440 32
WIRE 1440 32 1824 32
WIRE 1824 32 1824 176
WIRE 1728 160 1712 160
WIRE 1712 160 1712 32
WIRE 1792 176 1824 176
WIRE 1824 176 1888 176
WIRE 1888 176 2016 176
WIRE 2016 176 2016 624
WIRE 2016 624 -160 624
WIRE -160 624 -160 1056
WIRE -160 1056 64 1056
WIRE 208 1056 272 1056
WIRE 272 1056 352 1056
WIRE 272 1120 272 1136
WIRE 272 976 272 880
WIRE 272 880 672 880
WIRE 432 1056 496 1056
WIRE 496 1056 576 1056
WIRE 496 992 496 944
WIRE 496 944 672 944
WIRE 608 1040 608 1024
WIRE 608 1104 608 1120
WIRE 576 1088 528 1088
WIRE 672 880 672 944
WIRE 672 944 672 1072
WIRE 640 1072 672 1072
WIRE 672 1072 736 1072
WIRE 736 1072 800 1072
WIRE 880 1072 976 1072
WIRE 976 1072 1072 1072
WIRE 1152 1072 1248 1072
WIRE 1248 1072 1344 1072
WIRE 1248 1136 1248 1152
WIRE 1376 1024 1376 1008
WIRE 1376 1088 1376 1104
WIRE 976 1008 976 944
WIRE 976 944 1440 944
WIRE 1440 944 1440 1056
WIRE 1344 1040 1328 1040
WIRE 1328 1040 1328 944
WIRE 1408 1056 1440 1056
WIRE 1440 1056 1504 1056
WIRE 1504 1056 1600 1056
WIRE 1680 1056 1776 1056
WIRE 1776 1056 1904 1056
WIRE 1776 1120 1776 1136
FLAG -352 -224 VCC
IOPIN -352 -224 In
FLAG -352 -160 VREF
IOPIN -352 -160 In
FLAG -32 0 EP
IOPIN -32 0 In
FLAG -32 384 EN
IOPIN -32 384 In
FLAG 208 -112 VCC
FLAG 208 144 0
FLAG 208 496 VCC
FLAG 208 240 0
FLAG 592 80 0
FLAG 720 464 0
FLAG 832 192 RGM
IOPIN 832 192 Out
FLAG 1040 -64 VCC
FLAG 1040 448 0
FLAG 1104 448 VREF
FLAG 1264 192 INAOUT
FLAG 1664 288 VREF
FLAG 1760 128 VCC
FLAG 1760 224 0
FLAG 1888 176 HPO
FLAG 272 1136 0
FLAG 608 1024 VCC
FLAG 608 1120 0
FLAG 528 1088 VREF
FLAG 736 1072 MFO
FLAG 1248 1152 0
FLAG 1376 1008 VCC
FLAG 1376 1104 0
FLAG 1504 1056 LBO
FLAG 1776 1136 0
FLAG 1904 1056 ADC
IOPIN 1904 1056 Out
SYMBOL res 16 16 R270
WINDOW 0 32 56 VTop 2
WINDOW 3 0 56 VBottom 2
SYMATTR InstName Rsp
SYMATTR Value {RS}
SYMBOL res 16 400 R270
WINDOW 0 32 56 VTop 2
WINDOW 3 0 56 VBottom 2
SYMATTR InstName Rsn
SYMATTR Value {RS}
SYMBOL diode 224 -32 R180
SYMATTR InstName Dp1
SYMATTR Value 1N4148
SYMBOL diode 224 128 R180
SYMATTR InstName Dp2
SYMATTR Value 1N4148
SYMBOL diode 192 416 R0
SYMATTR InstName Dn1
SYMATTR Value 1N4148
SYMBOL diode 192 256 R0
SYMATTR InstName Dn2
SYMATTR Value 1N4148
SYMBOL res 432 16 R270
WINDOW 0 32 56 VTop 2
WINDOW 3 0 56 VBottom 2
SYMATTR InstName Rfp
SYMATTR Value {RRFI}
SYMBOL res 432 400 R270
WINDOW 0 32 56 VTop 2
WINDOW 3 0 56 VBottom 2
SYMATTR InstName Rfn
SYMATTR Value {RRFI}
SYMBOL cap 576 0 R0
SYMATTR InstName Ccmp
SYMATTR Value {CCM}
SYMBOL cap 640 160 R0
SYMATTR InstName Cdif
SYMATTR Value {CD}
SYMBOL cap 704 384 R0
SYMATTR InstName Ccmn
SYMATTR Value {CCM}
SYMBOL INA333 1040 192 R0
SYMATTR InstName XINA
SYMATTR Value INA333
SYMBOL res 864 80 R0
SYMATTR InstName RGa
SYMATTR Value {RGH}
SYMBOL res 864 192 R0
SYMATTR InstName RGb
SYMATTR Value {RGH}
SYMBOL cap 1312 208 R270
WINDOW 0 32 32 VTop 2
WINDOW 3 0 32 VBottom 2
SYMATTR InstName Chp1
SYMATTR Value {CHP}
SYMBOL res 1456 208 R180
SYMATTR InstName R1
SYMATTR Value {RHP1}
SYMBOL cap 1536 208 R270
WINDOW 0 32 32 VTop 2
WINDOW 3 0 32 VBottom 2
SYMATTR InstName Chp2
SYMATTR Value {CHP}
SYMBOL res 1648 176 R0
SYMATTR InstName Ra
SYMATTR Value {RHP2}
SYMBOL OpAmps\\opamp2 1760 112 R0
SYMATTR InstName XHP
SYMATTR Value TS922
SYMBOL cap 64 1072 R270
WINDOW 0 32 32 VTop 2
WINDOW 3 0 32 VBottom 2
SYMATTR InstName Cm0
SYMATTR Value {CM0}
SYMBOL res 112 1072 R270
WINDOW 0 32 56 VTop 2
WINDOW 3 0 56 VBottom 2
SYMATTR InstName Rm1
SYMATTR Value {RM1}
SYMBOL cap 256 1056 R0
SYMATTR InstName Cm1
SYMATTR Value {CM1}
SYMBOL res 288 1072 R180
SYMATTR InstName Rm2
SYMATTR Value {RM2}
SYMBOL res 336 1072 R270
WINDOW 0 32 56 VTop 2
WINDOW 3 0 56 VBottom 2
SYMATTR InstName Rm3
SYMATTR Value {RM3}
SYMBOL cap 512 1056 R180
SYMATTR InstName Cm2
SYMATTR Value {CM2}
SYMBOL OpAmps\\opamp2 608 1008 R0
SYMATTR InstName XMF
SYMATTR Value TS922
SYMBOL res 784 1088 R270
WINDOW 0 32 56 VTop 2
WINDOW 3 0 56 VBottom 2
SYMATTR InstName Rlb1
SYMATTR Value {RLB}
SYMBOL cap 992 1072 R180
SYMATTR InstName C21
SYMATTR Value {C21}
SYMBOL res 1056 1088 R270
WINDOW 0 32 56 VTop 2
WINDOW 3 0 56 VBottom 2
SYMATTR InstName Rlb2
SYMATTR Value {RLB}
SYMBOL cap 1232 1072 R0
SYMATTR InstName C22
SYMATTR Value {C22}
SYMBOL OpAmps\\opamp2 1376 992 R0
SYMATTR InstName XLB
SYMATTR Value TS922
SYMBOL res 1584 1072 R270
WINDOW 0 32 56 VTop 2
WINDOW 3 0 56 VBottom 2
SYMATTR InstName Rbk
SYMATTR Value {RBK}
SYMBOL cap 1760 1056 R0
SYMATTR InstName Cbk
SYMATTR Value {CBK}
TEXT -96 -480 Left 3 ;CANAL sEMG:  EP/EN  ->  1 ESD  ->  2 RFI  ->  3 INA333 x20  ->  4 HPF 20 Hz  ->  5 G2 + LPF A (MFB x125)  ->  6 LPF B + buffer (SK x1)  ->  7 RC  ->  ADC
TEXT -96 -416 Left 2 ;Ganancia total 503 (54 dB), banda 20-500 Hz. Este bloque se usa 3 veces en AuraVox_AFE.asc (XCH1..XCH3). Nombres = subcircuito AFE_CH de afe_channel.lib
TEXT -384 -288 Left 2 ;Alimentacion
RECTANGLE Normal -96 -336 384 512 2
TEXT -72 -296 Left 3 ;1  PROTECCION ESD
TEXT -72 -248 Left 2 ;Rs {RS} + 1N4148 a VCC y GND
RECTANGLE Normal 384 -336 800 512 2
TEXT 408 -296 Left 3 ;2  FILTRO RFI
TEXT 408 -248 Left 2 ;Rf 1k, Ccm {CCM}, Cd {CD}
RECTANGLE Normal 800 -336 1296 512 2
TEXT 824 -296 Left 3 ;3  INA333, G1 = 20.16
TEXT 824 -248 Left 2 ;G1 = 1+100k/RG, RG = 2 x 2.61k\npunto medio RGM -> RLD
RECTANGLE Normal 1296 -336 1952 512 2
TEXT 1320 -296 Left 3 ;4  HPF 20 Hz  (Sallen-Key 2o orden)
TEXT 1320 -248 Left 2 ;ganancia 1, Q 0.707
RECTANGLE Normal -96 688 736 1232 2
TEXT -72 728 Left 3 ;5  G2 + LPF etapa A: MFB 500 Hz, ganancia -125 (Q 0.54)
TEXT -72 776 Left 2 ;ARMADO: Cm1 = 100n || 47n poliester (147n). Cm0 bloquea la DC; invierte (no importa)
RECTANGLE Normal 736 688 1568 1232 2
TEXT 760 728 Left 3 ;6  LPF etapa B + BUFFER: Sallen-Key 500 Hz, ganancia 1 (Q 1.31)
TEXT 760 776 Left 2 ;ARMADO: C21 = 10n || 4.7n poliester (14.7n). MFB + SK = Butterworth 4o orden
RECTANGLE Normal 1568 688 2112 1232 2
TEXT 1592 728 Left 3 ;7  RC -> ADC
TEXT 1592 776 Left 2 ;100 ohm + 1 nF

The netlist it stands for:
* AuraVox_AFE.asc
VUSB V5 0 5
XXLDO V5 0 V5 VCC TLV75733P  ; pins IN GND EN OUT
CLDOI V5 0 1u
CLDOO VCC 0 1u
CBULK VCC 0 10u
RA1 VCC N001 100k
RA2 N001 0 100k
CA N001 0 10u
XXVR N001 VREF VCC 0 VREF TS922  ; pins In+ In- V+ V- OUT
VENV env 0 PULSE(0.05 1 0.3 30m 30m 170m 420m)
VECG ecg 0 PWL REPEAT FOREVER (0 0 0.08 0 0.12 0.12 0.16 0 0.20 -0.12 0.22 1 0.24 -0.25 0.27 0 0.42 0 0.50 0.3 0.58 0 0.833 0) ENDREPEAT
VM MAINS EARTH SINE(0 {VMAINS_TRAN} 50) AC {VMAINS_AC}
CMB MAINS BODY {CMB}
CBE BODY EARTH 200p
CGE EARTH 0 {CGE}
RGE EARTH 0 1G
BW1 w1 0 V=white(2e4*time+1e5)
LSEM1 w1 lc1 {LSEM}
CSEM1 lc1 f1 {CSEM}
RSEM1 f1 0 {RSEM}
BSEM1 semg1 0 V={AS1}*{KSEM}*V(f1)*V(env)
BIN1 n1 BODY V=V(semg1)+{KN}*({NMOV}*white(3*time+7e3)+{NWHT}*white(2e4*time+3e5)+{GE1}*V(ecg))
XXE1P n1 EP1 ELECTRODE Vhc=5m  ; pins SKIN LEAD
XXE1N BODY N002 ELECTRODE Vhc=-5m  ; pins SKIN LEAD
RI1 N002 EN1 {RIMB}
CI1 N002 EN1 47n
XXCH1 EP1 EN1 VCC VREF adc1 RGM1 canal
RDKIN1 adc1 0 1Meg
EDK1 N003 0 adc1 0 {GDK}
RDK1 N003 pin1 1k
CSH1 pin1 0 5p
BW2 w2 0 V=white(2e4*time+2e5)
LSEM2 w2 lc2 {LSEM}
CSEM2 lc2 f2 {CSEM}
RSEM2 f2 0 {RSEM}
BSEM2 semg2 0 V={AS2}*{KSEM}*V(f2)*V(env)
BIN2 n2 BODY V=V(semg2)+{KN}*({NMOV}*white(3*time+14e3)+{NWHT}*white(2e4*time+6e5)+{GE2}*V(ecg))
XXE2P n2 EP2 ELECTRODE Vhc=12m  ; pins SKIN LEAD
XXE2N BODY N004 ELECTRODE Vhc=0  ; pins SKIN LEAD
RI2 N004 EN2 {RIMB}
CI2 N004 EN2 47n
XXCH2 EP2 EN2 VCC VREF adc2 RGM2 canal
RDKIN2 adc2 0 1Meg
EDK2 N005 0 adc2 0 {GDK}
RDK2 N005 pin2 1k
CSH2 pin2 0 5p
BW3 w3 0 V=white(2e4*time+3e5)
LSEM3 w3 lc3 {LSEM}
CSEM3 lc3 f3 {CSEM}
RSEM3 f3 0 {RSEM}
BSEM3 semg3 0 V={AS3}*{KSEM}*V(f3)*V(env)
BIN3 n3 BODY V=V(semg3)+{KN}*({NMOV}*white(3*time+21e3)+{NWHT}*white(2e4*time+9e5)+{GE3}*V(ecg))
XXE3P n3 EP3 ELECTRODE Vhc=-8m  ; pins SKIN LEAD
XXE3N BODY N006 ELECTRODE Vhc=10m  ; pins SKIN LEAD
RI3 N006 EN3 {RIMB}
CI3 N006 EN3 47n
XXCH3 EP3 EN3 VCC VREF adc3 RGM3 canal
RDKIN3 adc3 0 1Meg
EDK3 N007 0 adc3 0 {GDK}
RDK3 N007 pin3 1k
CSH3 pin3 0 5p
RSM1 RGM1 N008 {RSM}
RSM2 RGM2 N008 {RSM}
RSM3 RGM3 N008 {RSM}
XXRLD VREF N008 VCC 0 RLDO TS922  ; pins In+ In- V+ V- OUT
CINT N008 RLDO {CINT}
RPAR N008 RLDO 10Meg
RLIM RLDO N009 {RLIM}
XXER BODY N009 ELECTRODE Vhc=0 Re={RER}  ; pins SKIN LEAD

* block symbol definitions
.subckt canal EP EN VCC VREF ADC RGM
Rsp EP N001 {RS}
Rsn EN N002 {RS}
Dp1 N001 VCC 1N4148
Dp2 0 N001 1N4148
Dn1 N002 VCC 1N4148
Dn2 0 N002 1N4148
Rfp N001 N003 {RRFI}
Rfn N002 N004 {RRFI}
Ccmp N003 0 {CCM}
Cdif N003 N004 {CD}
Ccmn N004 0 {CCM}
XXINA N003 N004 VCC 0 INAOUT VREF N005 N006 INA333  ; pins IN+ IN- VCC VEE OUT REF RG+ RG-
RGa N005 RGM {RGH}
RGb RGM N006 {RGH}
Chp1 INAOUT N007 {CHP}
R1 N007 HPO {RHP1}
Chp2 N007 N008 {CHP}
Ra N008 VREF {RHP2}
XXHP N008 HPO VCC 0 HPO TS922  ; pins In+ In- V+ V- OUT
Cm0 HPO P001 {CM0}
Rm1 P001 N009 {RM1}
Cm1 N009 0 {CM1}
Rm2 N009 MFO {RM2}
Rm3 N009 N010 {RM3}
Cm2 N010 MFO {CM2}
XXMF VREF N010 VCC 0 MFO TS922  ; pins In+ In- V+ V- OUT
Rlb1 MFO N011 {RLB}
C21 N011 LBO {C21}
Rlb2 N011 N012 {RLB}
C22 N012 0 {C22}
XXLB N012 LBO VCC 0 LBO TS922  ; pins In+ In- V+ V- OUT
Rbk LBO ADC {RBK}
Cbk ADC 0 {CBK}
* CANAL sEMG:  EP/EN  ->  1 ESD  ->  2 RFI  ->  3 INA333 x20  ->  4 HPF 20 Hz  ->  5 G2 + LPF A (MFB x125)  ->  6 LPF B + buffer (SK x1)  ->  7 RC  ->  ADC
* Ganancia total 503 (54 dB), banda 20-500 Hz. Este bloque se usa 3 veces en AuraVox_AFE.asc (XCH1..XCH3). Nombres = subcircuito AFE_CH de afe_channel.lib
* Alimentacion
* 1  PROTECCION ESD
* Rs {RS} + 1N4148 a VCC y GND
* 2  FILTRO RFI
* Rf 1k, Ccm {CCM}, Cd {CD}
* 3  INA333, G1 = 20.16
* G1 = 1+100k/RG, RG = 2 x 2.61k
* punto medio RGM -> RLD
* 4  HPF 20 Hz  (Sallen-Key 2o orden)
* ganancia 1, Q 0.707
* 5  G2 + LPF etapa A: MFB 500 Hz, ganancia -125 (Q 0.54)
* ARMADO: Cm1 = 100n || 47n poliester (147n). Cm0 bloquea la DC; invierte (no importa)
* 6  LPF etapa B + BUFFER: Sallen-Key 500 Hz, ganancia 1 (Q 1.31)
* ARMADO: C21 = 10n || 4.7n poliester (14.7n). MFB + SK = Butterworth 4o orden
* 7  RC -> ADC
* 100 ohm + 1 nF
.ends canal

.model D D
.lib standard.dio
* AuraVox - AFE sEMG: 3 entradas diferenciales (7 electrodos) -> 3 salidas al ADC del STM32N6570-DK
* Un Run = 2 pasos: paso 1 SIN RLD (referencia pasiva 390k), paso 2 CON RLD. Resultados: View > SPICE Error Log. Doble clic en un bloque CANAL para ver sus 8 etapas.
* QUE GRAFICAR: V(semg1) (sEMG limpio) | V(n1)-V(body) (entrada con ruido) | V(adc1)..V(adc3) (salidas del AFE) | V(pin1)..V(pin3) (lo que ve el ADC, 0-1.8 V) | V(body)-V(vref) (modo comun)
* ALIMENTACION: 5 V USB/powerbank -> TLV75733P -> 3.3 V, Y VREF
* 5 V desde el pin +5V del STM32N6570-DK; divisor 2 x 100k + 10u y seguidor TS922
* GENERADORES COMUNES
* envolvente de habla (rafagas) y ECG
* CUERPO Y RED 50 Hz
* CMB red-cuerpo, CBE cuerpo-tierra, CGE circuito-tierra (1 = USB a PC, peor caso)
* ENTRADA DIFERENCIAL POR CANAL
* sEMG = ruido blanco filtrado 90 Hz x envolvente; ruido = movimiento + ECG + blanco
* ELECTRODOS (6 de senal)
* 20k||47n; el - de cada par + 51k||47n
* AFE: 3 CANALES
* bloque CANAL = 7 etapas
* STM32N6570-DK: ARDUINO A1..A3
* amplificador de la placa 3.3 V -> 1.8 V + muestreo del ADC
* CH1  submentoniano
* CH1 -> A1 = PA9 (ADC12_INP10)
* CH2  labio inferior
* CH2 -> A2 = PA10 (ADC12_INP11)
* CH3  laringe
* CH3 -> A3 = PA12 (ADC12_INP13)
* RLD (7o electrodo, clavicula)
* integrador inversor; sensa el punto medio de RG de los 3 canales
* Salida del integrador -> RLIM 390k -> electrodo RLD. Para probar SIN RLD: borra el cable marcado y vuelve a dar Run
* ^ cable RLD -> electrodo: borralo para probar sin RLD
* VALORES (editar aqui si cambias un componente)
* E24; el bloque CANAL los usa en sus 3 copias
.param RS=100k RRFI=1k CCM=47p CD=100p RGH=2.7k
.param CHP=100n RHP1=56k RHP2=110k
.param CM0=10u RM1=2.4k RM2=300k RM3=2.2k CM1=147n CM2=1n
.param RLB=56k C21=14.7n C22=2.2n
.param RBK=100 CBK=1n RSM=620k CINT=1n RLIM=390k
* ESTIMULO Y SIMULACION
* KN=0 quita el ruido. AS = sEMG (V rms); GE = ECG pico; NMOV/NWHT calibrados a 500/20 uV rms
.param KN=1 KSEM=25 LSEM=1 CSEM=3.127u RSEM=807.8 NMOV=4.28m NWHT=82.4u
.param AS1=50u AS2=40u AS3=25u
.param GE1=120u GE2=50u GE3=250u
.param CMB=3p RIMB=51k RER=20k CGE=1 VMAINS_TRAN=311 VMAINS_AC=0
.param GDK={1.8/3.3}
.include opa.lib
.include models/ina_behav.lib
.include afe_channel.lib
.include models/tlv757_behav.lib
.tran 0 1.2 0 50u
.options gmin=100f plotwinsize=0 gminsteps=0 srcsteps=0
.meas tran VCC_V AVG V(vcc) FROM 0.3 TO 1.2
.meas tran VREF_V AVG V(vref) FROM 0.3 TO 1.2
.meas tran CM_cuerpo_Vpp PP V(body)-V(vref) FROM 0.3 TO 1.2
.meas tran sEMG1_uVrms RMS 1e6*V(semg1) FROM 0.35 TO 0.49
.meas tran ADC1_DC_V AVG V(adc1) FROM 0.3 TO 1.2
.meas tran ADC1_pk_V MAX abs(V(adc1,vref)) FROM 0.3 TO 1.2
.meas tran m1r AVG 1000*V(adc1,vref) FROM 0.35 TO 0.49
.meas tran q1r RMS 1000*V(adc1,vref) FROM 0.35 TO 0.49
.meas tran m1s AVG 1000*V(adc1,vref) FROM 0.58 TO 0.70
.meas tran q1s RMS 1000*V(adc1,vref) FROM 0.58 TO 0.70
.meas tran ADC1_rafaga_mVrms param sqrt(q1r**2-m1r**2)
.meas tran ADC1_reposo_mVrms param sqrt(q1s**2-m1s**2)
.meas tran SNR1_salida_dB param 20*log10(ADC1_rafaga_mVrms/ADC1_reposo_mVrms)
.meas tran PIN1_min_V MIN V(pin1) FROM 0.3 TO 1.2
.meas tran PIN1_max_V MAX V(pin1) FROM 0.3 TO 1.2
.meas tran sEMG2_uVrms RMS 1e6*V(semg2) FROM 0.35 TO 0.49
.meas tran ADC2_DC_V AVG V(adc2) FROM 0.3 TO 1.2
.meas tran ADC2_pk_V MAX abs(V(adc2,vref)) FROM 0.3 TO 1.2
.meas tran m2r AVG 1000*V(adc2,vref) FROM 0.35 TO 0.49
.meas tran q2r RMS 1000*V(adc2,vref) FROM 0.35 TO 0.49
.meas tran m2s AVG 1000*V(adc2,vref) FROM 0.58 TO 0.70
.meas tran q2s RMS 1000*V(adc2,vref) FROM 0.58 TO 0.70
.meas tran ADC2_rafaga_mVrms param sqrt(q2r**2-m2r**2)
.meas tran ADC2_reposo_mVrms param sqrt(q2s**2-m2s**2)
.meas tran SNR2_salida_dB param 20*log10(ADC2_rafaga_mVrms/ADC2_reposo_mVrms)
.meas tran PIN2_min_V MIN V(pin2) FROM 0.3 TO 1.2
.meas tran PIN2_max_V MAX V(pin2) FROM 0.3 TO 1.2
.meas tran sEMG3_uVrms RMS 1e6*V(semg3) FROM 0.35 TO 0.49
.meas tran ADC3_DC_V AVG V(adc3) FROM 0.3 TO 1.2
.meas tran ADC3_pk_V MAX abs(V(adc3,vref)) FROM 0.3 TO 1.2
.meas tran m3r AVG 1000*V(adc3,vref) FROM 0.35 TO 0.49
.meas tran q3r RMS 1000*V(adc3,vref) FROM 0.35 TO 0.49
.meas tran m3s AVG 1000*V(adc3,vref) FROM 0.58 TO 0.70
.meas tran q3s RMS 1000*V(adc3,vref) FROM 0.58 TO 0.70
.meas tran ADC3_rafaga_mVrms param sqrt(q3r**2-m3r**2)
.meas tran ADC3_reposo_mVrms param sqrt(q3s**2-m3s**2)
.meas tran SNR3_salida_dB param 20*log10(ADC3_rafaga_mVrms/ADC3_reposo_mVrms)
.meas tran PIN3_min_V MIN V(pin3) FROM 0.3 TO 1.2
.meas tran PIN3_max_V MAX V(pin3) FROM 0.3 TO 1.2
* BoM (3 canales, a comprar; detalle en docs/afe-emg/BoM_AFE_AuraVox.xlsx)
*  10 x 100k  resistencia
*   4 x 100p  cond. ceramico C0G
*   8 x 100n  cond. poliester (film)
*   4 x 2.4k  resistencia
*  10 x 1n  cond. ceramico C0G
*   5 x jumper Dupont M-H  Cable a Arduino A1..A3 del STM32N6570-DK
*   6 x TS922AIYDT  Op-amp doble TS922AIYDT (Global 001-TS922)
*   2 x 1u X7R  cond. ceramico/electrolitico
*   2 x hembra 2x8 2.54 THT  Conector de la placa para los 7 electrodos
*   1 x macho 1x40  Tira de header macho 1x40 2.54 THT
*   6 x jumper Dupont M-H  Cables Dupont para el microfono
*  16 x 1N4148  diodo
*   4 x INA333 modulo MCU-333  INA333 (modulo MCU-333)
*  12 x 56k  resistencia
*   4 x 300k  resistencia
*   4 x 10n + 4.7n en paralelo  cond. poliester o C0G
*   4 x 620k  resistencia
*   7 x S08D8  Adaptador SOIC-8 a DIP-8 (S08D8, Global; trae PCB y 2 headers de 4)
*   3 x jumper Dupont M-H  Cable 5 V y GND desde el DK
*   8 x jumper Dupont M-M  Bus de 8 cables Dupont macho (separado de una tira de 40)
*   1 x hembra 1x40  Tira de header hembra 1x40 2.54 THT
*   8 x 1k  resistencia
*  10 x 2.7k  resistencia
*   4 x 110k  resistencia
*   4 x 2.2k  resistencia
*   4 x 2.2n  cond. poliester o C0G
*   2 x 10M  resistencia
*   2 x TLV75733PDBVR  Regulador LDO 3.3 V TLV75733PDBVR (Global 014-75733)
*  50 x Skintact FS-RG1/10 32x41  Electrodo Ag/AgCl con broche 4 mm
*   1 x Alcohol isopropilico / gel  Alcohol isopropilico / gel
*   1 x 24 AWG rigido  Cable para puentes
*   8 x 47p  cond. ceramico C0G
*  12 x 100n  cond. ceramico/electrolitico
*   7 x 10u  cond. ceramico/electrolitico
*   4 x 100n + 47n en paralelo  cond. poliester o C0G
*   4 x 100  resistencia
*   2 x 390k  resistencia
*   3 x 1u  cond. ceramico/electrolitico
*   8 x broche 4 mm a pin  Cable de electrodo con broche (snap) 4 mm, idealmente apantallado
*   2 x 10 x 15 cm  Perfboard
*   1 x INMP441  Modulo microfono digital INMP441 (I2S)
.backanno
.end